# Altium schematic sheet Top-Sheet.SchDoc
size 420 x 297 mm; SheetNumber: 1; SheetTotal: 12
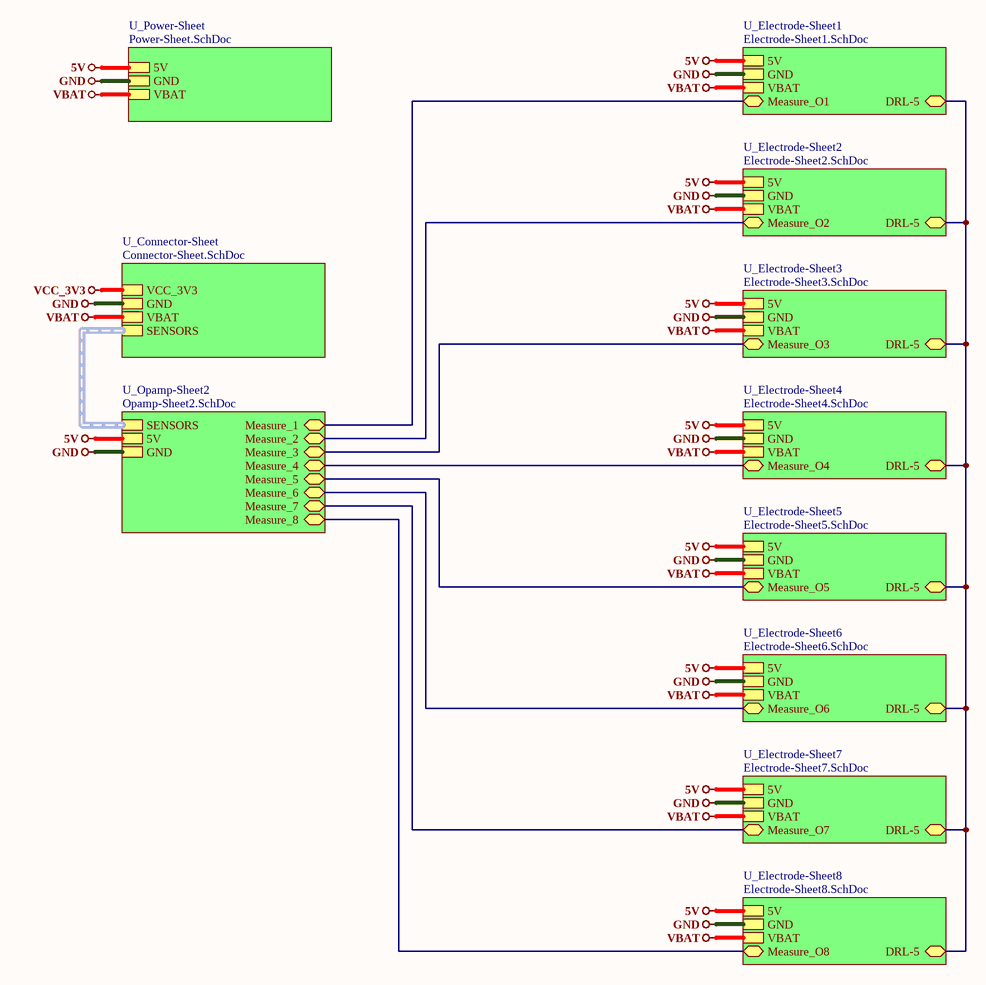
[diagram p0: Top-Sheet.SchDoc]

## Sub-sheets
U_Connector-Sheet = Connector-Sheet.SchDoc: SENSORS (harness SENSORS), VCC_3V3, GND, VBAT
U_Electrode-Sheet1 = Electrode-Sheet1.SchDoc: 5V, GND, VBAT, Measure_O1 (bidir), DRL-5 (bidir)
U_Electrode-Sheet2 = Electrode-Sheet2.SchDoc: 5V, GND, VBAT, Measure_O2 (bidir), DRL-5 (bidir)
U_Electrode-Sheet3 = Electrode-Sheet3.SchDoc: 5V, GND, VBAT, DRL-5 (bidir), Measure_O3 (bidir)
U_Electrode-Sheet4 = Electrode-Sheet4.SchDoc: 5V, GND, VBAT, Measure_O4 (bidir), DRL-5 (bidir)
U_Electrode-Sheet5 = Electrode-Sheet5.SchDoc: 5V, GND, VBAT, Measure_O5 (bidir), DRL-5 (bidir)
U_Electrode-Sheet6 = Electrode-Sheet6.SchDoc: 5V, GND, VBAT, DRL-5 (bidir), Measure_O6 (bidir)
U_Electrode-Sheet7 = Electrode-Sheet7.SchDoc: 5V, GND, VBAT, Measure_O7 (bidir), DRL-5 (bidir)
U_Electrode-Sheet8 = Electrode-Sheet8.SchDoc: 5V, GND, VBAT, Measure_O8 (bidir), DRL-5 (bidir)
U_Opamp-Sheet2 = Opamp-Sheet2.SchDoc: SENSORS (harness SENSORS), 5V, GND, Measure_1 (bidir), Measure_2 (bidir), Measure_3 (bidir), Measure_4 (bidir), Measure_5 (bidir), Measure_6 (bidir), Measure_7 (bidir), Measure_8 (bidir)
U_Power-Sheet = Power-Sheet.SchDoc: 5V, GND, VBAT

## Nets
5V: sheet U_Power-Sheet/5V, sheet U_Opamp-Sheet2/5V, sheet U_Electrode-Sheet1/5V, sheet U_Electrode-Sheet2/5V, sheet U_Electrode-Sheet3/5V, sheet U_Electrode-Sheet4/5V, sheet U_Electrode-Sheet5/5V, sheet U_Electrode-Sheet6/5V, sheet U_Electrode-Sheet7/5V, sheet U_Electrode-Sheet8/5V
GND: sheet U_Power-Sheet/GND, sheet U_Opamp-Sheet2/GND, sheet U_Connector-Sheet/GND, sheet U_Electrode-Sheet1/GND, sheet U_Electrode-Sheet2/GND, sheet U_Electrode-Sheet3/GND, sheet U_Electrode-Sheet4/GND, sheet U_Electrode-Sheet5/GND, sheet U_Electrode-Sheet6/GND, sheet U_Electrode-Sheet7/GND, sheet U_Electrode-Sheet8/GND
VBAT: sheet U_Power-Sheet/VBAT, sheet U_Connector-Sheet/VBAT, sheet U_Electrode-Sheet1/VBAT, sheet U_Electrode-Sheet2/VBAT, sheet U_Electrode-Sheet3/VBAT, sheet U_Electrode-Sheet4/VBAT, sheet U_Electrode-Sheet5/VBAT, sheet U_Electrode-Sheet6/VBAT, sheet U_Electrode-Sheet7/VBAT, sheet U_Electrode-Sheet8/VBAT
VCC_3V3: sheet U_Connector-Sheet/VCC_3V3
(unnamed): sheet U_Opamp-Sheet2/Measure_1, sheet U_Electrode-Sheet1/Measure_O1
(unnamed): sheet U_Opamp-Sheet2/Measure_2, sheet U_Electrode-Sheet2/Measure_O2
(unnamed): sheet U_Opamp-Sheet2/Measure_3, sheet U_Electrode-Sheet3/Measure_O3
(unnamed): sheet U_Opamp-Sheet2/Measure_4, sheet U_Electrode-Sheet4/Measure_O4
(unnamed): sheet U_Opamp-Sheet2/Measure_5, sheet U_Electrode-Sheet5/Measure_O5
(unnamed): sheet U_Opamp-Sheet2/Measure_6, sheet U_Electrode-Sheet6/Measure_O6
(unnamed): sheet U_Opamp-Sheet2/Measure_7, sheet U_Electrode-Sheet7/Measure_O7
(unnamed): sheet U_Opamp-Sheet2/Measure_8, sheet U_Electrode-Sheet8/Measure_O8
(unnamed): sheet U_Electrode-Sheet1/DRL-5, sheet U_Electrode-Sheet2/DRL-5, sheet U_Electrode-Sheet3/DRL-5, sheet U_Electrode-Sheet4/DRL-5, sheet U_Electrode-Sheet5/DRL-5, sheet U_Electrode-Sheet6/DRL-5, sheet U_Electrode-Sheet7/DRL-5, sheet U_Electrode-Sheet8/DRL-5

## Buses and harness runs
harness sheet U_Connector-Sheet/SENSORS = sheet U_Opamp-Sheet2/SENSORS

## Notes on the sheet
- File:
- Title:
- Date:
- Page
- Num:
- Total:
- Drawn By: Huzaifa Ali